# Altium schematic sheet MCU.SchDoc
size A2; SheetNumber: 4; SheetTotal: 6
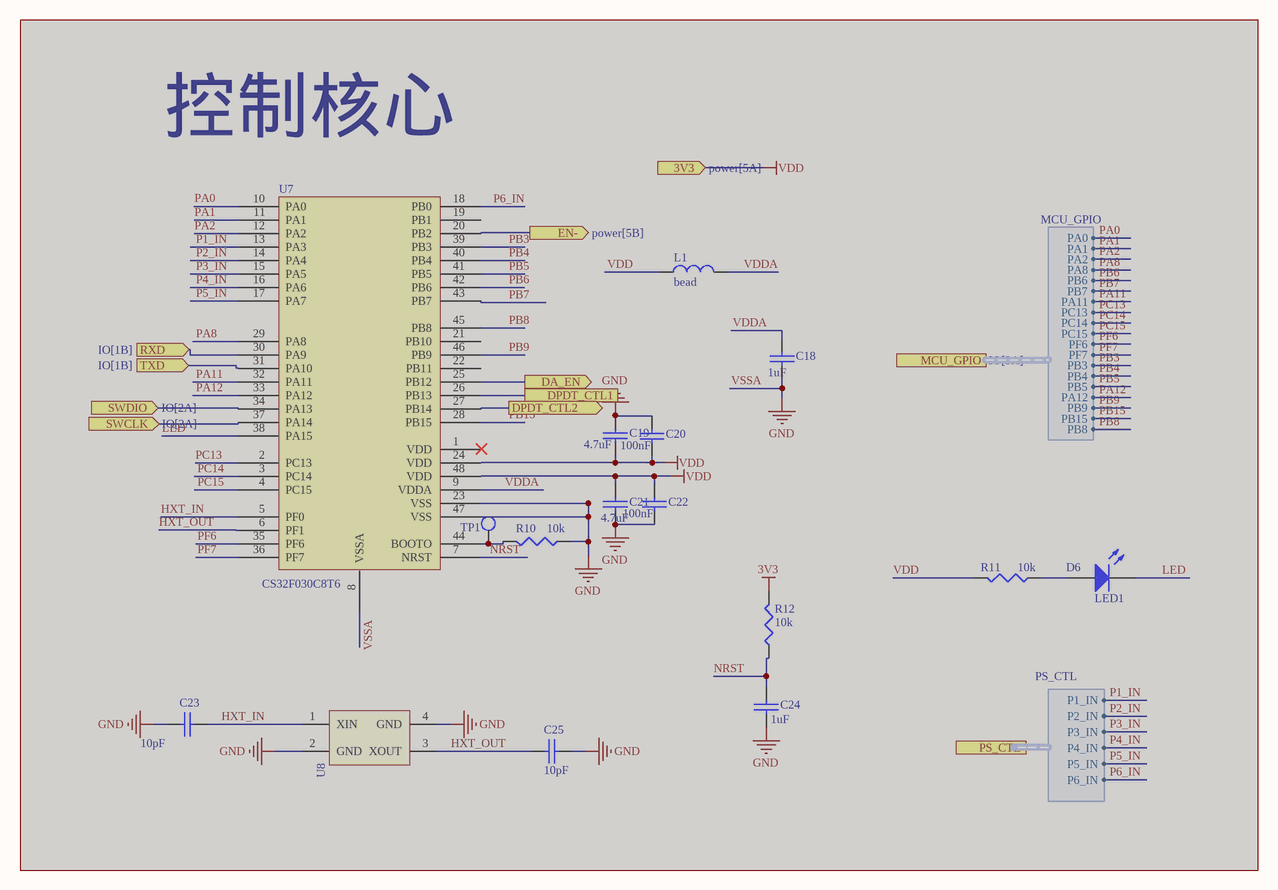
[diagram p0: MCU.SchDoc]

## Parts
C18  1uF  [0402_Z]  (masked out: inside a compile mask, not in the netlist)
C19  4.7uF  [0603_Z]  (masked out: inside a compile mask, not in the netlist)
C20  100nF  [0402_Z]  (masked out: inside a compile mask, not in the netlist)
C21  4.7uF  [0603_Z]  (masked out: inside a compile mask, not in the netlist)
C22  100nF  [0402_Z]  (masked out: inside a compile mask, not in the netlist)
C23  10pF  [0402_Z]  (masked out: inside a compile mask, not in the netlist)
C24  1uF  [0402_Z]  (masked out: inside a compile mask, not in the netlist)
C25  10pF  [0402_Z]  (masked out: inside a compile mask, not in the netlist)
D6  LED1  [0603_Z]  (masked out: inside a compile mask, not in the netlist)
L1  bead  [0603_Z]  (masked out: inside a compile mask, not in the netlist)
R10  10k  [0402_Z]  (masked out: inside a compile mask, not in the netlist)
R11  10k  [0402_Z]  (masked out: inside a compile mask, not in the netlist)
R12  10k  [0402_Z]  (masked out: inside a compile mask, not in the netlist)
TP1  TP_P  [TP_0.8]  (value not drawn)  (masked out: inside a compile mask, not in the netlist)
U7  CS32F030C8T6  [LQPF48]  (masked out: inside a compile mask, not in the netlist)
U8  8MHz  [CRYSTAL-SMD_4P-L3.2-W2.5-BL]  (value not drawn)  (masked out: inside a compile mask, not in the netlist)

## Ports
3V3 (in, see power[5A]), DA_EN (out), DPDT_CTL1 (out), DPDT_CTL2 (out), EN- (out, see power[5B]), MCU_GPIO (harness MCU_GPIO, see IO[3A]), PS_CTL (harness PS_CTL), RXD (in, see IO[1B]), SWCLK (in, see IO[2A]), SWDIO (in, see IO[2A]), TXD (in, see IO[1B])

## Harnesses
MCU_GPIO: PA0, PA1, PA2, PA8, PB6, PB7, PA11, PC13, PC14, PC15, PF6, PF7, PB3, PB4, PB5, PA12, PB9, PB15, PB8
PS_CTL: P1_IN, P2_IN, P3_IN, P4_IN, P5_IN, P6_IN

## Notes on the sheet
- 控制核心

## Library data of the parts
C18-C25 = CAP: 0402; Value: 20pF  NP0
D6 = LED0: Typical INFRARED GaAs LED; Published: 8-Jun-2000; LatestRevisionDate: 08-Jul-2005; LatestRevisionNote: Mech Layer 1 removed.; PackageReference: LED-0; Publisher: Altium Limited; PackageDescription: LED; 2 Leads
L1 = INDUCTOR1_1: INDUCTOR; Value: 33nH
R10-R12 = Res3: Resistor; Published: 8-Jun-2000; LatestRevisionDate: 04-Mar-2005; LatestRevisionNote: PCB Footprint replaced.; PackageReference: J1-0603; Publisher: Altium Limited; Value: 10k
U8 = XTAL 3225: PCB DECAL: 3225; Source_Path: E:\LI LELE\DESIGN KIT\DESIGN KIT_ESP8089_DEMO\ESP8089_DEMO.DSN